# Altium schematic sheet Fuel-Sensor-Sheet.SchDoc
size A4; SheetNumber: 9; SheetTotal: 10
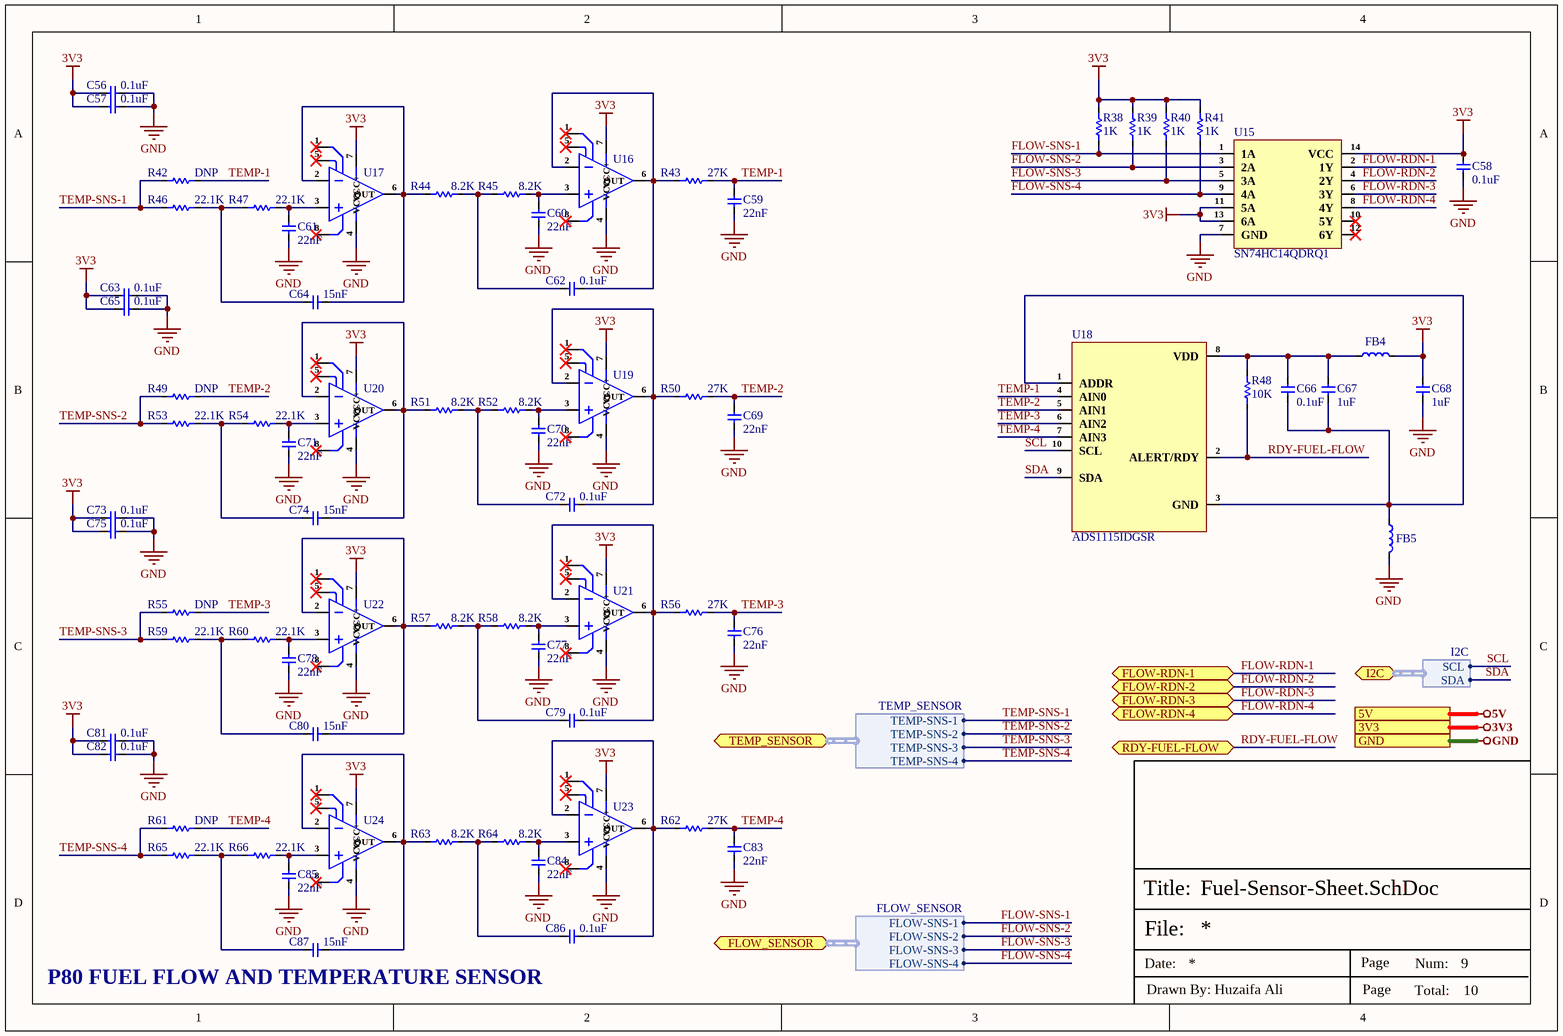
[diagram p0: Fuel-Sensor-Sheet.SchDoc]

## Parts
C56  0.1uF  [Cap-0402]
C57  0.1uF  [Cap-0402]
C58  0.1uF  [Cap-0402]
C59  22nF  [Cap-0402]
C60  22nF  [Cap-0402]
C61  22nF  [Cap-0402]
C62  0.1uF  [Cap-0402]
C63  0.1uF  [Cap-0402]
C64  15nF  [Cap-0402]
C65  0.1uF  [Cap-0402]
C66  0.1uF  [Cap-0402]
C67  1uF  [Cap-0402]
C68  1uF  [Cap-0402]
C69  22nF  [Cap-0402]
C70  22nF  [Cap-0402]
C71  22nF  [Cap-0402]
C72  0.1uF  [Cap-0402]
C73  0.1uF  [Cap-0402]
C74  15nF  [Cap-0402]
C75  0.1uF  [Cap-0402]
C76  22nF  [Cap-0402]
C77  22nF  [Cap-0402]
C78  22nF  [Cap-0402]
C79  0.1uF  [Cap-0402]
C80  15nF  [Cap-0402]
C81  0.1uF  [Cap-0402]
C82  0.1uF  [Cap-0402]
C83  22nF  [Cap-0402]
C84  22nF  [Cap-0402]
C85  22nF  [Cap-0402]
C86  0.1uF  [Cap-0402]
C87  15nF  [Cap-0402]
FB4  MMZ2012R102ATD25  [Ind-0805]  (value not drawn)
FB5  MMZ2012R102ATD25  [Ind-0805]  (value not drawn)
R38  1K  [Res-0402]
R39  1K  [Res-0402]
R40  1K  [Res-0402]
R41  1K  [Res-0402]
R42  DNP  [Res-0402]  (no BOM)
R43  27K  [Res-0402]
R44  8.2K  [Res-0402]
R45  8.2K  [Res-0402]
R46  22.1K  [Res-0402]
R47  22.1K  [Res-0402]
R48  10K  [Res-0402]
R49  DNP  [Res-0402]  (no BOM)
R50  27K  [Res-0402]
R51  8.2K  [Res-0402]
R52  8.2K  [Res-0402]
R53  22.1K  [Res-0402]
R54  22.1K  [Res-0402]
R55  DNP  [Res-0402]  (no BOM)
R56  27K  [Res-0402]
R57  8.2K  [Res-0402]
R58  8.2K  [Res-0402]
R59  22.1K  [Res-0402]
R60  22.1K  [Res-0402]
R61  DNP  [Res-0402]  (no BOM)
R62  27K  [Res-0402]
R63  8.2K  [Res-0402]
R64  8.2K  [Res-0402]
R65  22.1K  [Res-0402]
R66  22.1K  [Res-0402]
U15  SN74HC14QDRQ1  [SOIC-14]
U16  OPA350UA/2K5  [SOIC-8(0.154", 3.90mm Width)]  (value not drawn)
U17  OPA350UA/2K5  [SOIC-8(0.154", 3.90mm Width)]  (value not drawn)
U18  ADS1115IDGSR  [VSSOP-10]
U19  OPA350UA/2K5  [SOIC-8(0.154", 3.90mm Width)]  (value not drawn)
U20  OPA350UA/2K5  [SOIC-8(0.154", 3.90mm Width)]  (value not drawn)
U21  OPA350UA/2K5  [SOIC-8(0.154", 3.90mm Width)]  (value not drawn)
U22  OPA350UA/2K5  [SOIC-8(0.154", 3.90mm Width)]  (value not drawn)
U23  OPA350UA/2K5  [SOIC-8(0.154", 3.90mm Width)]  (value not drawn)
U24  OPA350UA/2K5  [SOIC-8(0.154", 3.90mm Width)]  (value not drawn)

## Ports
3V3 (see Top-Sheet[3C], CAN-Transceiver-Sheet[3D], Controller-Sheet[3D], Power-Sheet-2[3D], Storage-Sheet[3D], Tank-Level-Sensor-Sheet[3D], USB-to-UART-Sheet[3D]), 5V (see Top-Sheet[3C], CAN-Transceiver-Sheet[3D], Connector-Sheet[3D], Power-Sheet-1[3D], Power-Sheet-2[3D]), FLOW-RDN-1 (bidir, see Top-Sheet[3C]), FLOW-RDN-2 (bidir, see Top-Sheet[3C]), FLOW-RDN-3 (bidir, see Top-Sheet[3C]), FLOW-RDN-4 (bidir, see Top-Sheet[3C]), FLOW_SENSOR (bidir, harness FLOW_SENSOR, see Top-Sheet[4C], Connector-Sheet[2D]), GND (see Top-Sheet[3C], CAN-Transceiver-Sheet[3D], Connector-Sheet[3D], Controller-Sheet[3D], Power-Sheet-1[3D], Power-Sheet-2[3D], Storage-Sheet[3D], Tank-Level-Sensor-Sheet[3D], USB-to-UART-Sheet[3D]), I2C (bidir, harness I2C, see Top-Sheet[4C], Controller-Sheet[1D], Tank-Level-Sensor-Sheet[1D]), RDY-FUEL-FLOW (bidir, see Top-Sheet[3C]), TEMP_SENSOR (bidir, harness TEMP_SENSOR, see Top-Sheet[4C], Connector-Sheet[1D])

## Harnesses
I2C: SCL, SDA
TEMP_SENSOR: TEMP-SNS-1, TEMP-SNS-2, TEMP-SNS-3, TEMP-SNS-4
FLOW_SENSOR: FLOW-SNS-1, FLOW-SNS-2, FLOW-SNS-3, FLOW-SNS-4

## Nets
3V3: C56.1 C57.1 C58.1 C63.1 C65.1 C68.1 C73.1 C75.1 C81.1 C82.1 FB4.2 R38.2 R39.2 R40.2 R41.2 U15.11(5A) U15.13(6A) U15.14(VCC) U16.7(VCC+) U17.7(VCC+) U19.7(VCC+) U20.7(VCC+) U21.7(VCC+) U22.7(VCC+) U23.7(VCC+) U24.7(VCC+) ; port 3V3
5V: port 5V
GND: C56.2 C57.2 C58.2 C59.1 C60.1 C61.1 C63.2 C65.2 C68.2 C69.1 C70.1 C71.1 C73.2 C75.2 C76.1 C77.1 C78.1 C81.2 C82.2 C83.1 C84.1 C85.1 FB5.2 U15.7(GND) U16.4(VCC-) U17.4(VCC-) U19.4(VCC-) U20.4(VCC-) U21.4(VCC-) U22.4(VCC-) U23.4(VCC-) U24.4(VCC-) ; port GND
FLOW-RDN-1: U15.2(1Y) ; port FLOW-RDN-1
FLOW-RDN-2: U15.4(2Y) ; port FLOW-RDN-2
FLOW-RDN-3: U15.6(3Y) ; port FLOW-RDN-3
FLOW-RDN-4: U15.8(4Y) ; port FLOW-RDN-4
FLOW-SNS-1: R38.1 U15.1(1A) ; port FLOW_SENSOR.FLOW-SNS-1
FLOW-SNS-2: R39.1 U15.3(2A) ; port FLOW_SENSOR.FLOW-SNS-2
FLOW-SNS-3: R40.1 U15.5(3A) ; port FLOW_SENSOR.FLOW-SNS-3
FLOW-SNS-4: R41.1 U15.9(4A) ; port FLOW_SENSOR.FLOW-SNS-4
RDY-FUEL-FLOW: R48.1 U18.2(ALERT/RDY) ; port RDY-FUEL-FLOW
SCL: U18.10(SCL) ; port I2C.SCL
SDA: U18.9(SDA) ; port I2C.SDA
TEMP-1: C59.2 R42.2 R43.2 U18.4(AIN0)
TEMP-2: C69.2 R49.2 R50.2 U18.5(AIN1)
TEMP-3: C76.2 R55.2 R56.2 U18.6(AIN2)
TEMP-4: C83.2 R61.2 R62.2 U18.7(AIN3)
TEMP-SNS-1: R42.1 R46.1 ; port TEMP_SENSOR.TEMP-SNS-1
TEMP-SNS-2: R49.1 R53.1 ; port TEMP_SENSOR.TEMP-SNS-2
TEMP-SNS-3: R55.1 R59.1 ; port TEMP_SENSOR.TEMP-SNS-3
TEMP-SNS-4: R61.1 R65.1 ; port TEMP_SENSOR.TEMP-SNS-4
NetC60_2: C60.2 R45.2 U16.3(IN+)
NetC61_2: C61.2 R47.2 U17.3(IN+)
NetC62_1: C62.1 R44.2 R45.1
NetC62_2: C62.2 R43.1 U16.2(IN-) U16.6(OUT)
NetC64_1: C64.1 R46.2 R47.1
NetC64_2: C64.2 R44.1 U17.2(IN-) U17.6(OUT)
NetC66_1: C66.1 C67.1 FB4.1 R48.2 U18.8(VDD)
NetC66_2: C66.2 C67.2 FB5.1 U18.1(ADDR) U18.3(GND)
NetC70_2: C70.2 R52.2 U19.3(IN+)
NetC71_2: C71.2 R54.2 U20.3(IN+)
NetC72_1: C72.1 R51.2 R52.1
NetC72_2: C72.2 R50.1 U19.2(IN-) U19.6(OUT)
NetC74_1: C74.1 R53.2 R54.1
NetC74_2: C74.2 R51.1 U20.2(IN-) U20.6(OUT)
NetC77_2: C77.2 R58.2 U21.3(IN+)
NetC78_2: C78.2 R60.2 U22.3(IN+)
NetC79_1: C79.1 R57.2 R58.1
NetC79_2: C79.2 R56.1 U21.2(IN-) U21.6(OUT)
NetC80_1: C80.1 R59.2 R60.1
NetC80_2: C80.2 R57.1 U22.2(IN-) U22.6(OUT)
NetC84_2: C84.2 R64.2 U23.3(IN+)
NetC85_2: C85.2 R66.2 U24.3(IN+)
NetC86_1: C86.1 R63.2 R64.1
NetC86_2: C86.2 R62.1 U23.2(IN-) U23.6(OUT)
NetC87_1: C87.1 R65.2 R66.1
NetC87_2: C87.2 R63.1 U24.2(IN-) U24.6(OUT)

Not connected (* = marked no-connect by the designer): U15 10(5Y)* 12(6Y)*; U16 1(NC)* 5(NC)* 8(NC)*; U17 1(NC)* 5(NC)* 8(NC)*; U19 1(NC)* 5(NC)* 8(NC)*; U20 1(NC)* 5(NC)* 8(NC)*; U21 1(NC)* 5(NC)* 8(NC)*; U22 1(NC)* 5(NC)* 8(NC)*; U23 1(NC)* 5(NC)* 8(NC)*; U24 1(NC)* 5(NC)* 8(NC)*

## Notes on the sheet
- (near C87) P80 FUEL FLOW AND TEMPERATURE SENSOR
- File:
- Title:
- Date:
- Page
- Num:
- Total:
- Drawn By: Huzaifa Ali

## Library data of the parts
C56-C58 C63 C65 C66 C73 C75 C81 C82 = CL05B104KB54PNC: CAP CER 0.1UF 50V X7R 0402; Manufacturer: Samsung; Supplier 1: Digi-Key; Manufacturer Part Number: CL05B104KB54PNC; Stock 1: 8594; Pricing 1: 1=0.1, 10=0.067, 50=0.0366, 100=0.0299, 500=0.02138, 1000=0.01681, 2500=0.01528, 5000=0.01406 (USD); Supplier Part Number 1: 1276-CL05B104KB54PNCDKR-ND; LCSC Part Number: C307331
C59-C61 C69-C71 C76-C78 C83-C85 = CC0402JRX7R7BB223: CAP CER 0.022UF 16V X7R 0402; Manufacturer: Yageo; Tolerance: 5%; Item Type: Capacitor; Supplier: Digikey; Supplier Part Number: 311-3758-1-ND; Manufacturer Part Number: CC0402JRX7R7BB223; RoHS: Yes; Category: Ceramic Capacitors; Stock: 4203; Pricing: 1=0.1, 10=0.033, 50=0.0192, 100=0.0149, 500=0.0112, 1000=0.0088, 2500=0.008, 5000=0.00736 (USD); Mounting Technology: Surface Mount; Case/Package: 0402; Case Code (Imperial): 0402; Case Code (Metric): 1005; Weight: 2.3E-05oz; Min Operating Temperature: -55°C; Max Operating Temperature: 125°C; Value: 22nF; Packaging: Tape and Reel; Voltage Rating: 16V; Voltage Rating (DC): 16V; Dielectric: X7R; Termination: SMD/SMT; Series: CC; Length: 0.039inch; Width: 0.5mm; Thickness: 0.022inch; RoHS Compliant: Yes; Halogen Free: 5694HalogenFree; Lead Free: 5697LeadFree; ComponentLink1URL: https://datasheet.ciiva.com/13264/upy-gphc-x7r-6-3v-to-50v-8-12304-13264039.pdf?src-supplier=Mouser; ComponentLink1Description: https://datasheet.ciiva.com/13264/upy-gphc-x7r-6-3v-to-50v-8-12304-13264039.pdf?src-supplier=Mouser; LCSC Part Number: C541459
C62 C72 C79 C86 = CC0402JRX7R7BB104: CAP CER 0.1UF 16V X7R 0402; Manufacturer: Yageo; Material: 4241ConductorMaterial; Value: 100nF; Tolerance: 5%; Item Type: Capacitor; Supplier: Digikey; Supplier Part Number: 311-1676-1-ND; Manufacturer Part Number: CC0402JRX7R7BB104; RoHS: Yes; Category: Ceramic Capacitors; Stock: 1659111; Pricing: 1=0.1, 10=0.046, 50=0.0262, 100=0.0203, 500=0.01528, 1000=0.012, 2500=0.01091, 5000=0.01004 (USD); Mounting Technology: Surface Mount; Case/Package: 0402; Case Code (Metric): 1005; Case Code (Imperial): 0402; Min Operating Temperature: -55°C; Max Operating Temperature: 125°C; Dielectric: X7R; Packaging: Tape and Reel; Package Quantity: 10000; Voltage Rating (DC): 16V; Voltage Rating: 16V; Series: CC; Construction: Flat; Length: 0.039inch; Width: 0.02inch; Height: 0.5mm; Thickness: 0.022inch; Lead Free: Lead Free; Halogen Free: Halogen Free; RoHS Compliant: Yes; ComponentLink1URL: https://datasheet.ciiva.com/13210/upy-gphc-x7r-6-3v-to-50v-8-12304-13210152.pdf?src-supplier=Mouser; ComponentLink1Description: https://datasheet.ciiva.com/13210/upy-gphc-x7r-6-3v-to-50v-8-12304-13210152.pdf?src-supplier=Mouser; LCSC Part Number: C541464
C64 C74 C80 C87 = CC0402JRX7R7BB153: CAP CER 0.015UF 16V X7R 0402; Manufacturer: Yageo; Tolerance: 5%; Item Type: Capacitor; Supplier: Digikey; Supplier Part Number: 13-CC0402JRX7R7BB153CT-ND; Manufacturer Part Number: CC0402JRX7R7BB153; RoHS: Yes; Category: Ceramic Capacitors; Stock: 24539; Pricing: 1=0.1, 10=0.045, 50=0.0258, 100=0.0201, 500=0.0151, 1000=0.01186, 2500=0.01078, 5000=0.00992 (USD); Mounting Technology: Surface Mount; Case/Package: 0402; Case Code (Imperial): 0402; Case Code (Metric): 1005; Weight: 2.3E-05oz; Min Operating Temperature: -55°C; Max Operating Temperature: 125°C; Value: 15nF; Voltage Rating (DC): 16V; Packaging: Tape and Reel; Dielectric: X7R; Voltage Rating: 16V; Termination: SMD/SMT; Series: CC; Length: 0.039inch; Width: 0.02inch; Thickness: 0.022inch; Lead Free: Lead Free; Halogen Free: Halogen Free; RoHS Compliant: Yes; ComponentLink1URL: https://datasheet.ciiva.com/13263/upy-gphc-x7r-6-3v-to-50v-8-12304-13263342.pdf?src-supplier=Mouser; ComponentLink1Description: https://datasheet.ciiva.com/13263/upy-gphc-x7r-6-3v-to-50v-8-12304-13263342.pdf?src-supplier=Mouser; LCSC Part Number: C527002
C67 C68 = CL05A105KA5NQNC: CAP CER 1UF 25V X5R 0402; Manufacturer: Samsung; Material: Ceramic; Tolerance: 10%; Item Type: Capacitor; Supplier 1: Arrow Electronics; Manufacturer Part Number: CL05A105KA5NQNC; RoHS: Yes; Category: Ceramic Capacitors; Stock 1: 80000; Pricing 1: 10000=0.0256, 20000=0.0238, 30000=0.0228, 50000=0.0207, 100000=0.0175, 250000=0.0157 (USD); Mounting Technology: Surface Mount; Case/Package: 0402; Case Code (Metric): 1005; Case Code (Imperial): 0402; Min Operating Temperature: -55°C; Max Operating Temperature: 85°C; Package Quantity: 10000; Series: CL; Voltage Rating: 25V; Packaging: Tape and Reel; Construction: Flat; Value: 1uF; Dielectric: X5R; Length: 1mm; Width: 0.02inch; Height: 0.5mm; Depth: 0.5mm; Thickness: 0.022inch; Radiation Hardening: No; Lead Free: Lead Free; RoHS Compliant: Yes; ComponentLink1URL: https://datasheet.ciiva.com/25720/cl05a105ka5nqnc-25720771.pdf?src-supplier=Digi-Key; ComponentLink1Description: https://datasheet.ciiva.com/25720/cl05a105ka5nqnc-25720771.pdf?src-supplier=Digi-Key; ComponentLink2URL: https://datasheet.ciiva.com/3777/cl05a105ka5nqnc-3777709.pdf?src-supplier=Arrow+Electronics; ComponentLink2Description: https://datasheet.ciiva.com/3777/cl05a105ka5nqnc-3777709.pdf?src-supplier=Arrow+Electronics; ComponentLink3URL: https://datasheet.ciiva.com/29198/459147-da-01-en-vs-kondensator-0402-29198339.pdf?src-supplier=Conrad; ComponentLink3Description: https://datasheet.ciiva.com/29198/459147-da-01-en-vs-kondensator-0402-29198339.pdf?src-supplier=Conrad; Supplier Part Number 1: CL05A105KA5NQNC; LCSC Part Number: C52923
FB4 FB5 = MMZ2012R102ATD25: FERRITE BEAD 1K OHM 0805 1LN; Manufacturer: TDK; Number of Lines: 1; Max Current Rating: 500mA; DC Resistance (DCR): 300mR; Impedance: 1kR; Tolerance: 25%; Test Frequency: 100MHz; Supplier 1: Digi-Key; Manufacturer Part Number: MMZ2012R102ATD25; RoHS: Yes; Category: Ferrite Beads and Chips; Stock 1: 2942; Pricing 1: 1=0.11000, 10=0.09200, 25=0.08280, 50=0.06080, 100=0.05240, 250=0.04140, 500=0.03496, 1000=0.02944 (USD); Mount: Surface Mount; Case/Package: 0805; Case Code (Metric): 2012; Case Code (Imperial): 0805; Weight: 0.000194oz; Min Operating Temperature: -55°C; Max Operating Temperature: 125°C; Package Quantity: 4000; Packaging: Tape and Reel; Termination: SMD/SMT; Max DC Current: 500mA; Length: 0.079inch; Width: 0.049inch; Height: 0.041inch; Ratings: AEC-Q200; RoHS Compliant: Yes; ComponentLink1URL: http://www.mouser.com/ds/2/400/beads_automotive_signal_mmz_en-469244.pdf?src-supplier=Mouser; ComponentLink1Description: http://www.mouser.com/ds/2/400/beads_automotive_signal_mmz_en-469244.pdf?src-supplier=Mouser; ComponentLink2URL: https://product.tdk.com/info/en/catalog/datasheets/beads_automotive_signal_mmz2012_en.pdf?src-supplier=Digi-Key; ComponentLink2Description: https://product.tdk.com/info/en/catalog/datasheets/beads_automotive_signal_mmz2012_en.pdf?src-supplier=Digi-Key; Supplier Part Number 1: 445-MMZ2012R102ATD25CT-ND; LCSC Part Number: C307765; Item Type: Ferrite Bead
R38-R41 = RC0402FR-071KL: RES 1K OHM 1% 1/16W 0402; Manufacturer: Yageo; Resistance: 1kR; Temperature Coefficient: 100ppm/°C; Voltage Rating (DC): 50V; Power Rating: 62.5mW; Max Power Dissipation: 63mW; Item Type: Resistor; Supplier 1: Avnet; Manufacturer Part Number: RC0402FR-071KL; RoHS: Yes; Category: Chip SMD Resistors; Stock 1: 13030000; Pricing 1: 10000=0.00085, 20000=0.00087, 40000=0.00084, 60000=0.00083, 80000=0.00079, 100000=0.00078, 1000000=0.00076 (USD); Case/Package: 0402; Number of Pins: 2; Case Code (Imperial): 0402; Case Code (Metric): 1005; Size Code: 0402; Min Operating Temperature: -55°C; Max Operating Temperature: 155°C; Resistor Type: Thick Film; Tolerance: 1%; Packaging: Tape and Reel; Voltage Rating: 50V; Termination: SMD/SMT; Features: Moisture Resistant; Series: RC; Number of Terminations: 2; Resistance Tolerance: 1%; Construction: Rectangular; Technology: THICK FILM; Length: 1mm; Width: 0.5mm; Height: 0.32mm; Depth: 0.5mm; Reach SVHC Compliant: Yes; Lead Free: Lead Free; RoHS Compliant: Yes; Military Standard: Not; ComponentLink1URL: https://datasheet.ciiva.com/11819/0900766b80c66297-11819477.pdf?src-supplier=RSComponents; ComponentLink1Description: https://datasheet.ciiva.com/11819/0900766b80c66297-11819477.pdf?src-supplier=RSComponents; ComponentLink2URL: https://datasheet.ciiva.com/7983/1018594-7983502.pdf?src-supplier=Element14; ComponentLink2Description: https://datasheet.ciiva.com/7983/1018594-7983502.pdf?src-supplier=Element14; ComponentLink3URL: https://datasheet.ciiva.com/22747/1018594-22747513.pdf?src-supplier=Element14; ComponentLink3Description: https://datasheet.ciiva.com/22747/1018594-22747513.pdf?src-supplier=Element14; ComponentLink4URL: https://datasheet.ciiva.com/12666/pyu-rc0402-51-rohs-l-6-r-12666741.pdf?src-supplier=Mouser; ComponentLink4Description: https://datasheet.ciiva.com/12666/pyu-rc0402-51-rohs-l-6-r-12666741.pdf?src-supplier=Mouser; ComponentLink5URL: https://datasheet.ciiva.com/7849/1018594-7849869.pdf?src-supplier=Element14; ComponentLink5Description: https://datasheet.ciiva.com/7849/1018594-7849869.pdf?src-supplier=Element14; ComponentLink6URL: https://datasheet.ciiva.com/7849/1018594-7849871.pdf?src-supplier=Element14; ComponentLink6Description: https://datasheet.ciiva.com/7849/1018594-7849871.pdf?src-supplier=Element14; ComponentLink7URL: https://datasheet.ciiva.com/17063/pyu-rc0402-51-rohs-l-6-r-17063193.pdf?src-supplier=Future+Electronics; ComponentLink7Description: https://datasheet.ciiva.com/17063/pyu-rc0402-51-rohs-l-6-r-17063193.pdf?src-supplier=Future+Electronics; Supplier Part Number 1: RC0402FR-071KL; LCSC Part Number: C106235
R42 R49 R55 R61 = RC0402FR-070RL: RES 0 OHM JUMPER 1/16W 0402; Manufacturer: Yageo; Resistance: 0R; Tolerance: 1%; Power Rating: 62.5mW; Voltage Rating: 50V; Temperature Coefficient: 200ppm/°C; Max Power Dissipation: 63mW; Supplier 1: Mouser; Manufacturer Part Number: RC0402FR-070RL; RoHS: Yes; Category: Chip SMD Resistors; Stock 1: 8556842; Pricing 1: 1=0.10000, 10=0.01400, 50=0.01400, 100=0.00600, 1000=0.00300, 5000=0.00200, 10000=0.00100 (USD); Mount: Surface Mount; Case/Package: 0402; Contact Plating: Tin,Matte; Case Code (Imperial): 0402; Case Code (Metric): 1005; Size Code: 0402; Min Operating Temperature: -55°C; Max Operating Temperature: 155°C; Resistor Type: Thick Film; Packaging: Tape and Reel; Termination: SMD/SMT; Features: Moisture Resistant; Series: RC; Number of Terminations: 2; Length: 1mm; Width: 0.5mm; Height: 0.35mm; Radiation Hardening: No; Lead Free: Lead Free; RoHS Compliant: Yes; ComponentLink1URL: https://datasheet.ciiva.com/8896/pyu-rc0402-51-rohs-l-6-8896149.pdf?src-supplier=Avnet; ComponentLink1Description: https://datasheet.ciiva.com/8896/pyu-rc0402-51-rohs-l-6-8896149.pdf?src-supplier=Avnet; ComponentLink2URL: https://datasheet.ciiva.com/16790/pyu-rc0402-51-rohs-l-6-r-16790444.pdf?src-supplier=Future+Electronics; ComponentLink2Description: https://datasheet.ciiva.com/16790/pyu-rc0402-51-rohs-l-6-r-16790444.pdf?src-supplier=Future+Electronics; Supplier Part Number 1: 603-RC0402FR-070RL; LCSC Part Number: C106231
R43 R50 R56 R62 = RT0402BRE0727KL: RES SMD 27K OHM 0.1% 1/16W 0402; Manufacturer: Yageo; Value: 27kR; Max Power Dissipation: 63mW; Temperature Coefficient: 50ppm/°C; Voltage Rating (DC): 50V; Item Type: Resistor; Supplier: Digikey; Supplier Part Number: YAG4364CT-ND; Manufacturer Part Number: RT0402BRE0727KL; RoHS: Yes; Category: Chip SMD Resistors; Stock: 20118; Pricing: 1=0.16, 10=0.121, 50=0.0958, 100=0.0858, 500=0.06536, 1000=0.05776, 5000=0.0428 (USD); Case/Package: 0402; Case Code (Imperial): 0402; Min Operating Temperature: -55°C; Max Operating Temperature: 155°C; Package Quantity: 10000; Packaging: Tape and Reel; Tolerance: 0.1%; Number of Terminations: 2; Series: RT; Length: 0.039inch; Width: 0.02inch; Height: 0.014inch; Lead Free: Lead Free; RoHS Compliant: Yes; ComponentLink1URL: https://datasheet.ciiva.com/2582/pyu-rt-1-to-0-05-rohs-l-5-2582721.pdf?src-supplier=Digikey; ComponentLink1Description: https://datasheet.ciiva.com/2582/pyu-rt-1-to-0-05-rohs-l-5-2582721.pdf?src-supplier=Digikey; LCSC Part Number: C853174
R44 R45 R51 R52 R57 R58 R63 R64 = RT0402BRD078K2L: RES SMD 8.2K OHM 0.1% 1/16W 0402; Manufacturer: Yageo; Voltage Rating: 50V; Value: 8.2kR; Power Rating: 62.5mW; Temperature Coefficient: 25ppm/°C; Max Power Dissipation: 63mW; Item Type: Resistor; Supplier: Digikey; Supplier Part Number: YAG4318CT-ND; Manufacturer Part Number: RT0402BRD078K2L; RoHS: Yes; Category: Chip SMD Resistors; Stock: 17016; Pricing: 1=0.16, 10=0.121, 50=0.0958, 100=0.0859, 500=0.0654, 1000=0.0578, 5000=0.04283 (USD); Case/Package: 0402; Case Code (Metric): 1005; Case Code (Imperial): 0402; Min Operating Temperature: -55°C; Max Operating Temperature: 155°C; Tolerance: 0.1%; Packaging: Tape and Reel; Package Quantity: 10000; Termination: SMD/SMT; Number of Terminations: 2; Voltage Rating (DC): 50V; Series: RT; Length: 0.039inch; Width: 0.02inch; Height: 0.014inch; Lead Free: Lead Free; RoHS Compliant: Yes; ComponentLink1URL: https://datasheet.ciiva.com/2582/pyu-rt-1-to-0-05-rohs-l-5-2582520.pdf?src-supplier=Digikey; ComponentLink1Description: https://datasheet.ciiva.com/2582/pyu-rt-1-to-0-05-rohs-l-5-2582520.pdf?src-supplier=Digikey; LCSC Part Number: C852943
R46 R47 R53 R54 R59 R60 R65 R66 = RT0402BRD0722K1L: RES SMD 22.1KOHM 0.1% 1/16W 0402; Manufacturer: Yageo; Value: 22.1kR; Power Rating: 62.5mW; Voltage Rating: 50V; Max Power Dissipation: 63mW; Temperature Coefficient: 25ppm/°C; Item Type: Resistor; Supplier 1: Arrow Electronics; Manufacturer Part Number: RT0402BRD0722K1L; RoHS: Yes; Category: Chip SMD Resistors; Stock 1: 40000; Pricing 1: 10000=0.0417, 20000=0.0733, 30000=0.041, 40000=0.0719, 50000=0.0402, 100000=0.0393 (USD); Case/Package: 0402; Case Code (Metric): 1005; Case Code (Imperial): 0402; Weight: 2.3E-05oz; Min Operating Temperature: -55°C; Max Operating Temperature: 155°C; Tolerance: 0.1%; Packaging: Tape and Reel; Package Quantity: 10000; Number of Terminations: 2; Termination: SMD/SMT; Voltage Rating (DC): 50V; Series: RT; Length: 0.039inch; Width: 0.5mm; Height: 0.014inch; Lead Free: Lead Free; RoHS Compliant: Yes; ComponentLink1URL: https://datasheet.ciiva.com/2582/pyu-rt-1-to-0-05-rohs-l-5-2582235.pdf?src-supplier=Digi-Key; ComponentLink1Description: https://datasheet.ciiva.com/2582/pyu-rt-1-to-0-05-rohs-l-5-2582235.pdf?src-supplier=Digi-Key; ComponentLink2URL: https://datasheet.ciiva.com/12797/pyu-rt-1-to-0-05-rohs-l-4-12797086.pdf?src-supplier=Mouser; ComponentLink2Description: https://datasheet.ciiva.com/12797/pyu-rt-1-to-0-05-rohs-l-4-12797086.pdf?src-supplier=Mouser; Supplier Part Number 1: RT0402BRD0722K1L; LCSC Part Number: C852648
R48 = RC0402FR-0710KL: RES 10K OHM 1% 1/16W 0402; Manufacturer: Yageo; Resistance: 10kR; Voltage Rating (DC): 50V; Temperature Coefficient: 100ppm/°C; Power Rating: 62.5mW; Max Power Dissipation: 63mW; Item Type: Resistor; Supplier 1: Mouser; Manufacturer Part Number: RC0402FR-0710KL; RoHS: Yes; Category: Chip SMD Resistors; Stock 1: 18648329; Pricing 1: 1=0.10000, 10=0.01400, 50=0.01400, 100=0.00500, 1000=0.00300, 10000=0.00200 (USD); Case/Package: 0402; Number of Pins: 2; Case Code (Imperial): 0402; Case Code (Metric): 1005; Min Operating Temperature: -55°C; Max Operating Temperature: 155°C; Resistor Type: Thick Film; Tolerance: 1%; Packaging: Tape and Reel; Voltage Rating: 50V; Termination: SMD/SMT; Working Voltage: 50V; Number of Terminations: 2; Features: Moisture Resistant; Series: RC; Resistance Tolerance: 1%; Construction: Rectangular; Length: 1mm; Width: 0.5mm; Height: 0.32mm; Depth: 0.5mm; Lead Pitch: 0.2mm; REACH SVHC: No SVHC; Lead Free: Lead Free; RoHS Compliant: Yes; Military Standard: Not; ComponentLink1URL: https://datasheet.ciiva.com/7660/38568-7660787.pdf?src-supplier=Element14; ComponentLink1Description: https://datasheet.ciiva.com/7660/38568-7660787.pdf?src-supplier=Element14; ComponentLink2URL: https://datasheet.ciiva.com/7849/1686128-7849814.pdf?src-supplier=Element14; ComponentLink2Description: https://datasheet.ciiva.com/7849/1686128-7849814.pdf?src-supplier=Element14; ComponentLink3URL: https://datasheet.ciiva.com/7983/1018594-7983486.pdf?src-supplier=Element14; ComponentLink3Description: https://datasheet.ciiva.com/7983/1018594-7983486.pdf?src-supplier=Element14; ComponentLink4URL: https://datasheet.ciiva.com/22747/1018594-22747512.pdf?src-supplier=Element14; ComponentLink4Description: https://datasheet.ciiva.com/22747/1018594-22747512.pdf?src-supplier=Element14; ComponentLink5URL: https://datasheet.ciiva.com/12667/pyu-rc0402-51-rohs-l-6-r-12667067.pdf?src-supplier=Mouser; ComponentLink5Description: https://datasheet.ciiva.com/12667/pyu-rc0402-51-rohs-l-6-r-12667067.pdf?src-supplier=Mouser; ComponentLink6URL: https://datasheet.ciiva.com/7849/1784430-7849813.pdf?src-supplier=Element14; ComponentLink6Description: https://datasheet.ciiva.com/7849/1784430-7849813.pdf?src-supplier=Element14; ComponentLink7URL: https://datasheet.ciiva.com/7849/1784430-7849815.pdf?src-supplier=Element14; ComponentLink7Description: https://datasheet.ciiva.com/7849/1784430-7849815.pdf?src-supplier=Element14; Supplier Part Number 1: 603-RC0402FR-0710KL; LCSC Part Number: C60490
U15 = SN74HC14QDRQ1: IC INVERT SCHMITT 6CH 1IN 14SOIC; Manufacturer: Texas Instruments; Max Supply Voltage: 6V; Min Supply Voltage: 2V; Operating Supply Voltage: 5V; Propagation Delay: 21ns; Logic Function: Buffer,Inverter,Schmitt Trigger; Number of Elements: 6; Output Current: 25mA; Low Level Output Current: 5.2mA; Quiescent Current: 2uA; High Level Output Current: -5.2mA; Schmitt Trigger Input: Yes; Input Type: SCHMITT TRIGGER; Supplier: Mouser; Supplier Part Number: 595-SN74HC14QDRQ1; Manufacturer Part Number: SN74HC14QDRQ1; RoHS: Yes; Category: Logic Gates; Stock: 6966; Pricing: 1=0.68, 10=0.601, 50=0.601, 100=0.503, 1000=0.392, 10000=0.3 (USD); Mounting Technology: Surface Mount; Case/Package: SOIC; Pins: 14; Weight: 0.004318oz; Min Operating Temperature: -40°C; Max Operating Temperature: 125°C; Packaging: Tape and Reel; Package Quantity: 1; Number of Inputs: 6; Number of Circuits: 6; Turn-On Delay Time: 21ns; Number of Gates: 6; Number of Bits: 6; Series: 74HC; Technology: CMOS; Length: 8.65mm; Width: 3.91mm; Height: 1.58mm; Radiation Hardening: No; Reach SVHC Compliant: No; Lead Free: Lead Free; RoHS Compliant: Yes; ComponentLink1URL: https://datasheet.ciiva.com/15089/getdatasheetpartid-126971-15089251.pdf?src-supplier=Verical; ComponentLink1Description: https://datasheet.ciiva.com/15089/getdatasheetpartid-126971-15089251.pdf?src-supplier=Verical; ComponentLink2URL: https://datasheet.ciiva.com/1864/sn74hc14-q1-1864939.pdf?src-supplier=Digikey; ComponentLink2Description: https://datasheet.ciiva.com/1864/sn74hc14-q1-1864939.pdf?src-supplier=Digikey; ComponentLink3URL: https://datasheet.ciiva.com/1864/sn74hc14-q1-1864938.pdf?src-supplier=Digikey; ComponentLink3Description: https://datasheet.ciiva.com/1864/sn74hc14-q1-1864938.pdf?src-supplier=Digikey; ComponentLink4URL: https://datasheet.ciiva.com/1864/sn74hc14-q1-1864940.pdf?src-supplier=Digikey; ComponentLink4Description: https://datasheet.ciiva.com/1864/sn74hc14-q1-1864940.pdf?src-supplier=Digikey; ComponentLink5URL: https://datasheet.ciiva.com/14288/sn74hc14-q1-14288654.pdf?src-supplier=Avnet; ComponentLink5Description: https://datasheet.ciiva.com/14288/sn74hc14-q1-14288654.pdf?src-supplier=Avnet; ComponentLink6URL: https://datasheet.ciiva.com/48703/001073384-da-01-en-ic-hex-schmitt-sn74hc14qdrq1-soic-14-tid-48703180.pdf?src-supplier=Conrad; ComponentLink6Description: https://datasheet.ciiva.com/48703/001073384-da-01-en-ic-hex-schmitt-sn74hc14qdrq1-soic-14-tid-48703180.pdf?src-supplier=Conrad; LCSC Part Number: C507235; Item Type: IC
U16 U17 U19-U24 = OPA350UA/2K5: IC OPAMP GP 1 CIRCUIT 8SOIC; Manufacturer: Texas Instruments; Max Supply Voltage: 5.5V; Min Supply Voltage: 2.7V; Voltage Gain: 122dB; Common Mode Rejection Ratio: 66dB; Number of Channels: 1; Slew Rate: 22V/µs; Max I/O Voltage: 1mV; Gain Bandwidth Product: 38MHz; Input Bias Current: 10pA; Input Offset Voltage (Vos): 500uV; Operating Supply Current: 5.2mA; Output Current per Channel: 40mA; Power Supply Rejection Ratio (PSRR): 87.96dB; Amplifier Type: GENERAL PURPOSE; Supply Current: 7.5mA; Supplier: Digikey; Supplier Part Number: 296-41366-1-ND; Manufacturer Part Number: OPA350UA/2K5; RoHS: Yes; Category: Amplifiers - Op Amps, Buffer, Instrumentation; Stock: 2896; Pricing: 1=2.98, 10=2.675, 25=2.5292, 100=2.1921, 250=2.07964, 500=1.86606, 1000=1.57378 (USD); Case/Package: D; Pins: 8; Weight: 0.002677oz; Min Operating Temperature: -40°C; Max Operating Temperature: 85°C; Packaging: Tape and Reel; Package Quantity: 2500; Number of Circuits: 1; Bandwidth: 38MHz; Series: MicroAmplifier™; Unity Gain Bandwidth Product: 38MHz; Number of Elements: 1; Technology: CMOS; Radiation Hardening: No; Lead Free: Lead Free; RoHS Compliant: Yes; ComponentLink1URL: https://datasheet.ciiva.com/1814/opa350-1814331.pdf?src-supplier=Digikey; ComponentLink1Description: https://datasheet.ciiva.com/1814/opa350-1814331.pdf?src-supplier=Digikey; ComponentLink2URL: https://datasheet.ciiva.com/14347/sbos099c-14347229.pdf?src-supplier=Avnet; ComponentLink2Description: https://datasheet.ciiva.com/14347/sbos099c-14347229.pdf?src-supplier=Avnet; LCSC Part Number: C13388; Item Type: IC
U18 = ADS1115IDGSR: IC ADC 16BIT SIGMA-DELTA 10VSSOP; Manufacturer: Texas Instruments; Interface: I2C; Number of Bits: 16; Sampling Rate: 860S/s; Number of A/D Converters: 1; Resolution: 16b; Polarity: Bipolar; Min Supply Voltage: 2V; Max Supply Voltage: 5.5V; Supply Type: Single; Conversion Rate: 0.86KS/s; Number of Inputs: 4; Integral Nonlinearity (INL): 1LSB; Power Dissipation: 900uW; Nominal Supply Current: 150uA; Number of Channels: 2; Supplier: Mouser; Supplier Part Number: 595-ADS1115IDGSR; Manufacturer Part Number: ADS1115IDGSR; RoHS: Yes; Category: Analog to Digital Converters (ADCs); Stock: 5925; Pricing: 1=5.44, 10=4.76, 50=4.76, 100=4.01, 1000=2.88, 10000=2.78 (USD); Case/Package: VSSOP; Pins: 10; Contact Plating: Gold; Min Operating Temperature: -40°C; Max Operating Temperature: 125°C; Package Quantity: 2500; Packaging: Tape and Reel; Number of Converters: 1; Max Supply Voltage (DC): 5.5V; Min Supply Voltage (DC): 2V; Series: -; Length: 3mm; Width: 3mm; Height: 1.07mm; Thickness: 1.02mm; Reach SVHC Compliant: No; Lead Free: Lead Free; RoHS Compliant: Yes; ComponentLink1URL: https://datasheet.ciiva.com/4031/47725463s8438921n7713-4031028.pdf?src-supplier=Arrow+Electronics; ComponentLink1Description: https://datasheet.ciiva.com/4031/47725463s8438921n7713-4031028.pdf?src-supplier=Arrow+Electronics; LCSC Part Number: C37593; Item Type: IC